# Altium schematic sheet Controller_Sheet.SchDoc
size A4; DocumentNumber: 4; SheetNumber: 4; SheetTotal: 7
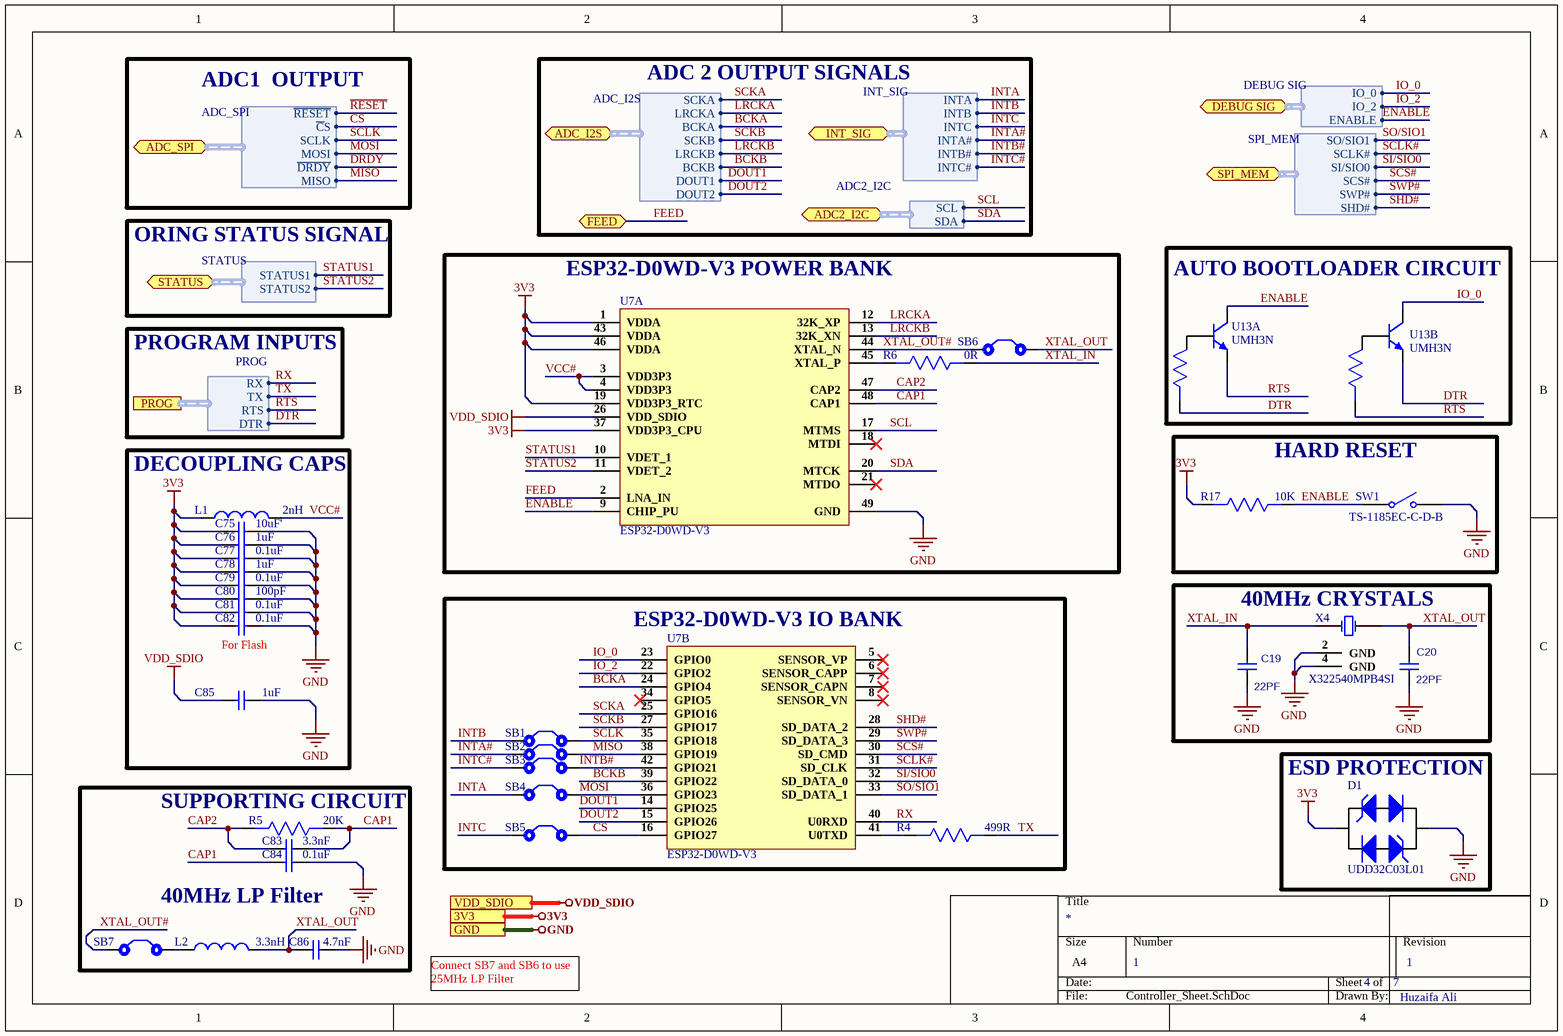
[diagram p0: Controller_Sheet.SchDoc]

## Parts
C19  22PF  [Cap 0402]
C20  22PF  [Cap 0402]
C75  10uF'  [Cap 0603]
C76  1uF  [Cap 0603]
C77  0.1uF  [Cap 0603]
C78  1uF  [Cap 0603]
C79  0.1uF  [Cap 0603]
C80  100pF  [Cap 0603]
C81  0.1uF  [Cap 0603]
C82  0.1uF  [Cap 0603]
C83  3.3nF  [Cap 0402]
C84  0.1uF  [Cap 0603]
C85  1uF  [Cap 0603]
C86  4.7nF  [Cap 0603]
D1  UDD32C03L01  [UDD32C03L01]
L1  2nH  [IND 0603]
L2  3.3nH  [IND 0603]
R4  499R  [Res0603]
R5  20K  [Res0603]
R6  0R  [Res0603]
R17  10K  [Res0603]
SB1  Solder Bridge  [Solder Bridge]  (value not drawn)
SB2  Solder Bridge  [Solder Bridge]  (value not drawn)
SB3  Solder Bridge  [Solder Bridge]  (value not drawn)
SB4  Solder Bridge  [Solder Bridge]  (value not drawn)
SB5  Solder Bridge  [Solder Bridge]  (value not drawn)
SB6  Solder Bridge  [Solder Bridge]  (value not drawn)
SB7  Solder Bridge  [Solder Bridge]  (value not drawn)
SW1  TS-1185EC-C-D-B  [TS-1185EC-C-D-B]
U7  ESP32-D0WD-V3  [ESP32-D0WD-V3]  (parts A,B of 2)
U13  UMH3N  [UMH3N]  (parts A,B of 2)
X4  X322540MPB4SI  [X322540MPB4SI]

## Blocks framed on the sheet
ESP32-D0WD-V3 POWER BANK: R6 SB6 U7
AUTO BOOTLOADER CIRCUIT: U13
DECOUPLING CAPS: C75-C82 C85 L1
HARD RESET: R17 SW1
ESP32-D0WD-V3 IO BANK: R4 SB1-SB5 U7
40MHz CRYSTALS: C19 C20 X4
ESD PROTECTION: D1

## Ports
3V3, ADC2_I2C (bidir, harness ADC2_I2C), ADC_I2S (bidir, harness ADC_I2S), ADC_SPI (bidir, harness ADC_SPI), DEBUG SIG (bidir, harness DEBUG SIG), FEED (bidir), GND, INT_SIG (bidir, harness INT_SIG), PROG (harness PROG), SPI_MEM (bidir, harness SPI_MEM), STATUS (bidir, harness STATUS), VDD_SDIO

## Harnesses
PROG: RX, TX, RTS, DTR
STATUS: STATUS1, STATUS2
ADC_SPI: ~{RESET}, ~{C}S, SCLK, MOSI, ~{DRDY}, MISO
INT_SIG: INTA, INTB, INTC, INTA#, INTB#, INTC#
ADC2_I2C: SCL, SDA
ADC_I2S: SCKA, LRCKA, BCKA, SCKB, LRCKB, BCKB, DOUT1, DOUT2
DEBUG SIG: IO_0, IO_2, ENABLE
SPI_MEM: SO/SIO1, SCLK#, SI/SIO0, SCS#, SWP#, SHD#

## Nets
3V3: C75.1 C76.1 C77.1 C78.1 C79.1 C80.1 C81.1 C82.1 D1.1 L1.1 R17.2 U7.1(VDDA) U7.19(VDD3P3_RTC) U7.37(VDD3P3_CPU) U7.43(VDDA) U7.46(VDDA) ; port 3V3
GND: C19.1 C20.1 C75.2 C76.2 C77.2 C78.2 C79.2 C80.2 C81.2 C82.2 C84.2 C85.2 C86.2 D1.2 SW1.2 U7.49(GND) X4.2(GND) X4.4(GND) ; port GND
VDD_SDIO: C85.1 U7.26(VDD_SDIO) ; port VDD_SDIO
~{C}S: SB5.2 U7.16(GPIO27) ; port ADC_SPI.~{C}S
~{DRDY}: port ADC_SPI.~{DRDY}
~{RESET}: port ADC_SPI.~{RESET}
BCKA: U7.24(GPIO4) ; port ADC_I2S.BCKA
BCKB: U7.39(GPIO22) ; port ADC_I2S.BCKB
CAP1: C83.2 C84.1 R5.1 U7.48(CAP1)
CAP2: C83.1 R5.2 U7.47(CAP2)
DOUT1: U7.14(GPIO25) ; port ADC_I2S.DOUT1
DOUT2: U7.15(GPIO26) ; port ADC_I2S.DOUT2
DTR: U13.2 U13.4(E) ; port PROG.DTR
ENABLE: R17.1 SW1.1 U7.9(CHIP_PU) U13.6(C) ; port DEBUG SIG.ENABLE
FEED: U7.2(LNA_IN) ; port FEED
INTA: SB4.1 ; port INT_SIG.INTA
INTA#: SB2.1 ; port INT_SIG.INTA#
INTB: SB1.1 ; port INT_SIG.INTB
INTB#: SB3.2 U7.42(GPIO21) ; port INT_SIG.INTB#
INTC: SB5.1 ; port INT_SIG.INTC
INTC#: SB3.1 ; port INT_SIG.INTC#
IO_0: U7.23(GPIO0) U13.3(C) ; port DEBUG SIG.IO_0
IO_2: U7.22(GPIO2) ; port DEBUG SIG.IO_2
LRCKA: U7.12(32K_XP) ; port ADC_I2S.LRCKA
LRCKB: U7.13(32K_XN) ; port ADC_I2S.LRCKB
MISO: SB2.2 U7.38(GPIO19) ; port ADC_SPI.MISO
MOSI: SB4.2 U7.36(GPIO23) ; port ADC_SPI.MOSI
RTS: U13.1(E) U13.5 ; port PROG.RTS
RX: U7.40(U0RXD) ; port PROG.RX
SCKA: U7.25(GPIO16) ; port ADC_I2S.SCKA
SCKB: U7.27(GPIO17) ; port ADC_I2S.SCKB
SCL: U7.17(MTMS) ; port ADC2_I2C.SCL
SCLK: SB1.2 U7.35(GPIO18) ; port ADC_SPI.SCLK
SCLK#: U7.31(SD_CLK) ; port SPI_MEM.SCLK#
SCS#: U7.30(SD_CMD) ; port SPI_MEM.SCS#
SDA: U7.20(MTCK) ; port ADC2_I2C.SDA
SHD#: U7.28(SD_DATA_2) ; port SPI_MEM.SHD#
SI/SIO0: U7.32(SD_DATA_0) ; port SPI_MEM.SI/SIO0
SO/SIO1: U7.33(SD_DATA_1) ; port SPI_MEM.SO/SIO1
STATUS1: U7.10(VDET_1) ; port STATUS.STATUS1
STATUS2: U7.11(VDET_2) ; port STATUS.STATUS2
SWP#: U7.29(SD_DATA_3) ; port SPI_MEM.SWP#
TX: R4.1 ; port PROG.TX
VCC#: L1.2 U7.3(VDD3P3) U7.4(VDD3P3)
XTAL_IN: C19.2 R6.1 X4.1(CRYSTAL)
XTAL_OUT: C20.2 C86.1 L2.2 SB6.2 X4.3(CRYSTAL)
XTAL_OUT#: SB6.1 SB7.1 U7.44(XTAL_N)
NetL2_1: L2.1 SB7.2
NetR4_2: R4.2 U7.41(U0TXD)
NetR6_2: R6.2 U7.45(XTAL_P)

Not connected (* = marked no-connect by the designer): U7 5(SENSOR_VP)* 6(SENSOR_CAPP)* 7(SENSOR_CAPN)* 8(SENSOR_VN)* 18(MTDI)* 21(MTDO)* 34(GPIO5)*

## Notes on the sheet
- ADC1  OUTPUT
- ADC 2 OUTPUT SIGNALS
- ORING STATUS SIGNAL
- PROGRAM INPUTS
- (near C82) For Flash
- (near R5) SUPPORTING CIRCUIT
- 40MHz LP Filter
- Connect SB7 and SB6 to use 25MHz LP Filter
- 1
- Huzaifa Ali

## Library data of the parts
C19 C20 = 04025A220FAT2A: CAP CER 22PF 50V C0G/NP0 0402; Manufacturer: Kyocera AVX; Tolerance: 1%; Dielectric: C0G; ComponentLink1URL: http://psearch.murata.com/capacitor/product/GCM219R71C105KA37%23.pdf; ComponentLink1Description: http://psearch.murata.com/capacitor/product/GCM219R71C105KA37%23.pdf; ComponentLink2URL: http://search.murata.co.jp/Ceramy/image/img/A01X/partnumbering_e_02.pdf; ComponentLink2Description: http://search.murata.co.jp/Ceramy/image/img/A01X/partnumbering_e_02.pdf; ComponentLink3URL: http://psearch.en.murata.com/capacitor/product/GCM219R71C105KA37%23.pdf; ComponentLink3Description: http://psearch.en.murata.com/capacitor/product/GCM219R71C105KA37%23.pdf; ComponentLink4URL: http://uk.rs-online.com/webdocs/0ef9/0900766b80ef92d0.pdf; ComponentLink4Description: http://uk.rs-online.com/webdocs/0ef9/0900766b80ef92d0.pdf; ComponentLink5URL: http://www.yageo.com/documents/recent/UPY-GP_NP0_16V-to-50V_16.pdf; ComponentLink5Description: http://www.yageo.com/documents/recent/UPY-GP_NP0_16V-to-50V_16.pdf; ComponentLink6URL: http://www.farnell.com/datasheets/1443161.pdf; ComponentLink6Description: http://www.farnell.com/datasheets/1443161.pdf; ComponentLink7URL: http://www.yageo.com/documents/recent/UPY-GP_NP0_16V-to-50V_8.pdf; ComponentLink7Description: http://www.yageo.com/documents/recent/UPY-GP_NP0_16V-to-50V_8.pdf; ComponentLink8URL: http://www.farnell.com/datasheets/1132289.pdf; ComponentLink8Description: http://www.farnell.com/datasheets/1132289.pdf; ComponentLink9URL: http://www.mouser.com/ds/2/447/Yageo_UPY-GP_NP0_16V-to-50V_9-358835.pdf; ComponentLink9Description: http://www.mouser.com/ds/2/447/Yageo_UPY-GP_NP0_16V-to-50V_9-358835.pdf; ComponentLink10URL: https://www.verical.com/server-webapp/html/getDatasheet?partID=370074; ComponentLink10Description: https://www.verical.com/server-webapp/html/getDatasheet?partID=370074; ComponentLink11URL: http://catalogs.avx.com/SurfaceMount.pdf; ComponentLink11Description: http://catalogs.avx.com/SurfaceMount.pdf; ComponentLink12URL: http://www.avxcorp.com/docs/Catalogs/ccog.pdf; ComponentLink12Description: http://www.avxcorp.com/docs/Catalogs/ccog.pdf; ComponentLink13URL: http://www.mouser.com/ds/2/40/C0GNP0-Dielectric-951274.pdf; ComponentLink13Description: http://www.mouser.com/ds/2/40/C0GNP0-Dielectric-951274.pdf; Supplier 1: Digi-Key; Manufacturer Part Number: 04025A220FAT2A; Stock 1: 100000; Pricing 1: 1=0.67, 10=0.472, 100=0.3105, 500=0.23, 1000=0.1955, 2500=0.184, 5000=0.1725 (USD); Mount: Surface Mount; Case/Package: 0402; Case Code (Metric): 1005; Case Code (Imperial): 0402; Contact Plating: Matte,Tin; Min Operating Temperature: -55°C; Max Operating Temperature: 125°C; Capacitance: 22pF; Packaging: Tape and Reel; Voltage Rating (DC): 50V; Voltage Rating: 50V; Package Quantity: 1; Termination: SMD/SMT; Length: 1mm; Height: 0.56mm; Depth: 0.5mm; Width: 0.02inch; Thickness: 0.022inch; Radiation Hardening: No; REACH SVHC: Unknown; Lead Free: Lead Free; Supplier Part Number 1: 478-5765-1-ND
C75 = CL10A106MA8NRNC: CAP CER 10UF 25V X5R 0603; Manufacturer: Samsung; Tolerance: 20%; Supplier 1: Avnet; Manufacturer Part Number: CL10A106MA8NRNC; RoHS: Yes; Category: Ceramic Capacitors; Pricing 1: 4000=0.03753, 8000=0.03700, 16000=0.03595, 24000=0.03515, 32000=0.03383, 40000=0.03304, 400000=0.03225 (USD); Mount: Surface Mount; Case/Package: 0603; Case Code (Metric): 1608; Case Code (Imperial): 0603; Contact Plating: Tin; Min Operating Temperature: -55°C; Max Operating Temperature: 85°C; Package Quantity: 1; Packaging: Tape and Reel; Capacitance: 10uF; Voltage Rating: 25V; Dielectric: X5R; Termination: Wraparound; Series: CL; Construction: Flat; Length: 0.063inch; Width: 0.031inch; Thickness: 0.035inch; Lead Free: Lead Free; RoHS Compliant: Yes; ComponentLink1URL: https://datasheet.ciiva.com/25766/cl10a106ma8nrnc-25766562.pdf?src-supplier=Digi-Key; ComponentLink1Description: https://datasheet.ciiva.com/25766/cl10a106ma8nrnc-25766562.pdf?src-supplier=Digi-Key; Supplier Part Number 1: CL10A106MA8NRNC
C76 C78 C85 = CC0603KRX5R8BB105: CAP CER 1UF 25V X5R 0603; Manufacturer: Yageo; Tolerance: 10%; Supplier 1: Digi-Key; Manufacturer Part Number: CC0603KRX5R8BB105; RoHS: Yes; Category: Ceramic Capacitors; Stock 1: 919939; Pricing 1: 1=0.12000, 10=0.08400, 50=0.04760, 100=0.03940, 500=0.02764, 1000=0.02288 (USD); Mount: Surface Mount; Case/Package: 0603; Number of Pins: 2; Case Code (Metric): 1608; Case Code (Imperial): 0603; Min Operating Temperature: -55°C; Max Operating Temperature: 85°C; Capacitance: 1uF; Dielectric: X5R; Package Quantity: 1; Voltage Rating: 25V; Packaging: Tape and Reel; Termination: SMD/SMT; Voltage Rating (DC): 25V; Series: CC; Construction: Flat; Length: 1.6mm; Width: 0.031inch; Height: 0.8mm; Thickness: 0.035inch; Depth: 0.8mm; Radiation Hardening: No; REACH SVHC: No SVHC; Lead Free: Lead Free; Halogen Free: Halogen Free; RoHS Compliant: Yes; ComponentLink1URL: https://datasheet.ciiva.com/176/mlccorderingcode-176785.pdf?src-supplier=Digi-Key; ComponentLink1Description: https://datasheet.ciiva.com/176/mlccorderingcode-176785.pdf?src-supplier=Digi-Key; ComponentLink2URL: https://datasheet.ciiva.com/176/mlccorderingcode-176786.pdf?src-supplier=Digi-Key; ComponentLink2Description: https://datasheet.ciiva.com/176/mlccorderingcode-176786.pdf?src-supplier=Digi-Key; ComponentLink3URL: https://datasheet.ciiva.com/176/mlccorderingcode-176787.pdf?src-supplier=Digi-Key; ComponentLink3Description: https://datasheet.ciiva.com/176/mlccorderingcode-176787.pdf?src-supplier=Digi-Key; ComponentLink4URL: https://datasheet.ciiva.com/17436/upy-gphc-x5r-4v-to-50v-12-17436952.pdf?src-supplier=Avnet+Europe; ComponentLink4Description: https://datasheet.ciiva.com/17436/upy-gphc-x5r-4v-to-50v-12-17436952.pdf?src-supplier=Avnet+Europe; ComponentLink5URL: https://datasheet.ciiva.com/7978/1525783-7978171.pdf?src-supplier=Element14; ComponentLink5Description: https://datasheet.ciiva.com/7978/1525783-7978171.pdf?src-supplier=Element14; ComponentLink6URL: https://datasheet.ciiva.com/11586/upy-gphc-x5r-4v-to-50v-12-11586318.pdf?src-supplier=Avnet; ComponentLink6Description: https://datasheet.ciiva.com/11586/upy-gphc-x5r-4v-to-50v-12-11586318.pdf?src-supplier=Avnet; Supplier Part Number 1: 311-1445-1-ND
C77 C79 C81 C82 C84 = CC0603KRX7R0BB104: CAP CER 0.1UF 100V X7R 0603; Manufacturer: Yageo; Capacitance: 100nF; Tolerance: 10%; Supplier 1: Digi-Key; Manufacturer Part Number: CC0603KRX7R0BB104; RoHS: Yes; Category: Ceramic Capacitors; Stock 1: 60476; Pricing 1: 1=0.19000, 10=0.13500, 50=0.07680, 100=0.06370, 500=0.04466, 1000=0.03696 (USD); Mount: Surface Mount; Case/Package: 0603; Case Code (Metric): 1608; Case Code (Imperial): 0603; Weight: 7.1E-05oz; Min Operating Temperature: -55°C; Max Operating Temperature: 125°C; Package Quantity: 4000; Voltage Rating: 100V; Packaging: Tape and Reel; Dielectric: X7R; Termination: SMD/SMT; Resistor Type: Ceramic; Voltage Rating (DC): 100V; Series: CC; Length: 0.063inch; Width: 0.031inch; Thickness: 0.035inch; Depth: 0.8mm; Lead Free: Lead Free; RoHS Compliant: Yes; ComponentLink1URL: https://datasheet.ciiva.com/6277/mlccorderingcode-6277030.pdf?src-supplier=Digi-Key; ComponentLink1Description: https://datasheet.ciiva.com/6277/mlccorderingcode-6277030.pdf?src-supplier=Digi-Key; ComponentLink2URL: https://datasheet.ciiva.com/6277/mlccorderingcode-6277081.pdf?src-supplier=Digi-Key; ComponentLink2Description: https://datasheet.ciiva.com/6277/mlccorderingcode-6277081.pdf?src-supplier=Digi-Key; ComponentLink3URL: https://datasheet.ciiva.com/6277/mlccorderingcode-6277082.pdf?src-supplier=Digi-Key; ComponentLink3Description: https://datasheet.ciiva.com/6277/mlccorderingcode-6277082.pdf?src-supplier=Digi-Key; Supplier Part Number 1: 311-1523-1-ND
C80 = CC0603KRX7R8BB101: CAP CER 100PF 25V X7R 0603; Manufacturer: Yageo; Tolerance: 10%; Supplier 1: Avnet; Manufacturer Part Number: CC0603KRX7R8BB101; RoHS: Yes; Category: Ceramic Capacitors; Stock 1: 12000; Pricing 1: 4000=0.00493, 8000=0.00479, 16000=0.00466, 24000=0.00452, 32000=0.00439 (USD); Mount: Surface Mount; Case/Package: 0603; Case Code (Imperial): 0603; Case Code (Metric): 1608; Weight: 7.1E-05oz; Min Operating Temperature: -55°C; Max Operating Temperature: 125°C; Packaging: Tape and Reel; Capacitance: 100pF; Voltage Rating (DC): 25V; Dielectric: X7R; Voltage Rating: 25V; Termination: SMD/SMT; Resistor Type: Ceramic; Series: CC; Length: 0.063inch; Width: 0.031inch; Thickness: 0.035inch; Depth: 0.8mm; Lead Free: Lead Free; Halogen Free: Halogen Free; RoHS Compliant: Yes; ComponentLink1URL: https://datasheet.ciiva.com/13265/upy-gphc-x7r-6-3v-to-50v-8-12304-13265007.pdf?src-supplier=Mouser; ComponentLink1Description: https://datasheet.ciiva.com/13265/upy-gphc-x7r-6-3v-to-50v-8-12304-13265007.pdf?src-supplier=Mouser; Supplier Part Number 1: CC0603KRX7R8BB101
C83 = CGA2B2X7R1H332M050BA: CAP CER 3300PF 50V X7R 0402; Manufacturer: TDK; Tolerance: 20%; Supplier 1: Digi-Key; Manufacturer Part Number: CGA2B2X7R1H332M050BA; RoHS: Yes; Category: Ceramic Capacitors; Stock 1: 30365; Pricing 1: 1=0.10000, 10=0.05400, 50=0.02960, 100=0.02430, 500=0.01732, 1000=0.01361, 2500=0.01238, 5000=0.01138 (USD); Mount: Surface Mount; Case/Package: 0402; Case Code (Metric): 1005; Case Code (Imperial): 0402; Min Operating Temperature: -55°C; Max Operating Temperature: 125°C; Package Quantity: 10000; Packaging: Tape and Reel; Capacitance: 3.3nF; Voltage Rating: 50V; Series: CGA; Length: 0.039inch; Width: 0.02inch; Thickness: 0.022inch; Ratings: AEC-Q200; RoHS Compliant: Yes; ComponentLink1URL: https://product.tdk.com/info/en/documents/chara_sheet/CGA2B2X7R1H332M050BA.pdf?src-supplier=Digi-Key; ComponentLink1Description: https://product.tdk.com/info/en/documents/chara_sheet/CGA2B2X7R1H332M050BA.pdf?src-supplier=Digi-Key; ComponentLink2URL: https://product.tdk.com/info/en/catalog/datasheets/mlcc_automotive_general_en.pdf?src-supplier=Digi-Key; ComponentLink2Description: https://product.tdk.com/info/en/catalog/datasheets/mlcc_automotive_general_en.pdf?src-supplier=Digi-Key; ComponentLink3URL: http://product.tdk.com/en/catalog/datasheets/mlcc_automotive_general_en.pdf?src-supplier=Avnet; ComponentLink3Description: http://product.tdk.com/en/catalog/datasheets/mlcc_automotive_general_en.pdf?src-supplier=Avnet; Supplier Part Number 1: 445-12276-1-ND
C86 = CC0603KRX7R8BB472: CAP SMD 4700pF ±10% 25V X7R 0603; Manufacturer: Yageo; Supplier 1: Mouser; Manufacturer Part Number: CC0603KRX7R8BB472; RoHS: Yes; Category: Ceramic Capacitors; Stock 1: 6256; Pricing 1: 1=0.10000, 10=0.02900, 50=0.02900, 100=0.02400, 500=0.01700, 1000=0.01400, 2000=0.01300, 4000=0.01000, 8000=0.00900, 10000=0.00900 (USD); Mount: Surface Mount; Case/Package: 0603; Case Code (Imperial): 0603; Case Code (Metric): 1608; Weight: 7.1E-05oz; Min Operating Temperature: -55°C; Max Operating Temperature: 125°C; Packaging: Tape and Reel; Capacitance: 4.7nF; Tolerance: 10%; Voltage Rating (DC): 25V; Voltage Rating: 25V; Dielectric: X7R; Termination: SMD/SMT; Resistor Type: Ceramic; Series: CC; Length: 1.6mm; Width: 0.031inch; Thickness: 0.035inch; Depth: 0.8mm; Radiation Hardening: No; Lead Free: Lead Free; Halogen Free: Halogen Free; RoHS Compliant: Yes; ComponentLink1URL: https://datasheet.ciiva.com/26862/getdatasheetpartid-650523-26862841.pdf?src-supplier=Verical; ComponentLink1Description: https://datasheet.ciiva.com/26862/getdatasheetpartid-650523-26862841.pdf?src-supplier=Verical; ComponentLink2URL: https://datasheet.ciiva.com/13208/upy-gphc-x7r-6-3v-to-50v-8-12304-13208589.pdf?src-supplier=Mouser; ComponentLink2Description: https://datasheet.ciiva.com/13208/upy-gphc-x7r-6-3v-to-50v-8-12304-13208589.pdf?src-supplier=Mouser; Supplier Part Number 1: 603-CC603KRX7R8BB472
D1 = UDD32C03L01: 15V 19A 3.3V 4V Bidirectional SOD-323 ESD Protection Devices ROHS; Manufacturer: Brightking; Manufacturer Part No: UDD32C03L01; Package: SOD-323; ComponentLink1Description: LCSC; ComponentLink1URL: https://lcsc.com/product-detail/span-style-background-color-ff0-ESD-span-Protection-Devices_Brightking-Elec-TAIWAN-UDD32C03L01_C78439.html
L1 = SDCL1608C2N0STDF: 2nH ±0.3nH 0603 Inductors; Manufacturer: Sunlord; Rated Current: 300mA; Inductance: 2nH; Package Case: 0603
L2 = LQG18HN3N3S00D: FIXED IND 3.3NH 1A 120 MOHM SMD; Manufacturer: Murata; Core Material: Air; Max DC Current: 500mA; DC Resistance (DCR): 150mR; Q Factor: 12; Self Resonant Frequency: 6GHz; Shielding: Unshielded; Test Frequency: 100MHz; Supplier 1: RSComponents; Manufacturer Part Number: LQG18HN3N3S00D; RoHS: Yes; Category: Fixed Inductors; Stock 1: 1; Pricing 1: 10=0.18800, 500=0.08200, 1000=0.07100, 2000=0.05900, 5000=0.05600 (USD); Mount: Surface Mount; Case/Package: 0603; Case Code (Metric): 1608; Case Code (Imperial): 0603; Min Operating Temperature: -55°C; Max Operating Temperature: 85°C; Inductance: 3.3nH; Packaging: Tape and Reel; Package Quantity: 4000; Current Rating: 500mA; Termination: SMD/SMT; DC Current: 500mA; Series: LQG18H; Rated Current-Max: 500mA; Length: 1.6mm; Width: 0.8mm; Height: 0.8mm; Height - Seated (Max): 0.037inch; Depth: 0.95mm; Radiation Hardening: No; REACH SVHC: No SVHC; Military Standard: Not; Lead Free: Lead Free; RoHS Compliant: Yes; ComponentLink1URL: https://datasheet.ciiva.com/11801/0900766b80f1087c-11801482.pdf?src-supplier=RSComponents; ComponentLink1Description: https://datasheet.ciiva.com/11801/0900766b80f1087c-11801482.pdf?src-supplier=RSComponents; ComponentLink2URL: https://datasheet.ciiva.com/8510/l0075s0083lqg18h-8510694.pdf?src-supplier=Avnet; ComponentLink2Description: https://datasheet.ciiva.com/8510/l0075s0083lqg18h-8510694.pdf?src-supplier=Avnet; ComponentLink3URL: https://datasheet.ciiva.com/8002/5102-8002599.pdf?src-supplier=Element14; ComponentLink3Description: https://datasheet.ciiva.com/8002/5102-8002599.pdf?src-supplier=Element14; ComponentLink4URL: https://datasheet.ciiva.com/6690/l0075s0083lqg18h-6690799.pdf?src-supplier=Digi-Key; ComponentLink4Description: https://datasheet.ciiva.com/6690/l0075s0083lqg18h-6690799.pdf?src-supplier=Digi-Key; ComponentLink5URL: https://datasheet.ciiva.com/4978/o05e-4978491.pdf?src-supplier=Mouser; ComponentLink5Description: https://datasheet.ciiva.com/4978/o05e-4978491.pdf?src-supplier=Mouser; ComponentLink6URL: https://datasheet.ciiva.com/18089/getdatasheetpartid-180322-18089964.pdf?src-supplier=Verical; ComponentLink6Description: https://datasheet.ciiva.com/18089/getdatasheetpartid-180322-18089964.pdf?src-supplier=Verical; ComponentLink7URL: https://datasheet.ciiva.com/6690/l0075s0083lqg18h-6690797.pdf?src-supplier=Digi-Key; ComponentLink7Description: https://datasheet.ciiva.com/6690/l0075s0083lqg18h-6690797.pdf?src-supplier=Digi-Key; ComponentLink8URL: https://datasheet.ciiva.com/6690/l0075s0083lqg18h-6690798.pdf?src-supplier=Digi-Key; ComponentLink8Description: https://datasheet.ciiva.com/6690/l0075s0083lqg18h-6690798.pdf?src-supplier=Digi-Key; Supplier Part Number 1: 7254954
R4 = RC0603FR-07499RL: RES SMD 499Ω ± 1.00% 0.1W ± 100ppm/℃ 0603; Manufacturer: Yageo; Tolerance: 1%; Temperature Coefficient: 100ppm/°C; Power Rating: 100mW; Voltage Rating: 50V; Supplier 1: RSComponents; Manufacturer Part Number: RC0603FR-07499RL; RoHS: Yes; Category: Chip SMD Resistors; Stock 1: 900; Pricing 1: 5000=0.00300, 10000=0.00300, 15000=0.00300, 20000=0.00200 (GBP); Mount: Surface Mount; Case/Package: 0603; Contact Plating: Tin,Matte; Case Code (Metric): 1608; Case Code (Imperial): 0603; Size Code: 0603; Min Operating Temperature: -55°C; Max Operating Temperature: 155°C; Resistance: 499R; Resistor Type: Thick Film; Package Quantity: 1; Packaging: Tape and Reel; Number of Terminations: 2; Termination: SMD/SMT; Max Power Dissipation: 100mW; Voltage Rating (DC): 50V; Features: Moisture Resistant; Series: RC; Construction: Rectangular; Technology: THICK FILM; Length: 1.6mm; Width: 0.031inch; Height: 0.45mm; Depth: 0.8mm; Radiation Hardening: No; Military Standard: Not; Lead Free: Lead Free; RoHS Compliant: Yes; ComponentLink1URL: https://datasheet.ciiva.com/11808/0900766b80f96399-11808558.pdf?src-supplier=RSComponents; ComponentLink1Description: https://datasheet.ciiva.com/11808/0900766b80f96399-11808558.pdf?src-supplier=RSComponents; ComponentLink2URL: https://datasheet.ciiva.com/2453/pyu-r-int-thick-7-2453956.pdf?src-supplier=Digi-Key; ComponentLink2Description: https://datasheet.ciiva.com/2453/pyu-r-int-thick-7-2453956.pdf?src-supplier=Digi-Key; ComponentLink3URL: https://datasheet.ciiva.com/2453/pyu-r-int-thick-7-2453957.pdf?src-supplier=Digi-Key; ComponentLink3Description: https://datasheet.ciiva.com/2453/pyu-r-int-thick-7-2453957.pdf?src-supplier=Digi-Key; ComponentLink4URL: https://datasheet.ciiva.com/2453/pyu-r-int-thick-7-2453955.pdf?src-supplier=Digi-Key; ComponentLink4Description: https://datasheet.ciiva.com/2453/pyu-r-int-thick-7-2453955.pdf?src-supplier=Digi-Key; ComponentLink5URL: https://datasheet.ciiva.com/12558/rc0603-272842-12558391.pdf?src-supplier=Mouser; ComponentLink5Description: https://datasheet.ciiva.com/12558/rc0603-272842-12558391.pdf?src-supplier=Mouser; ComponentLink6URL: https://datasheet.ciiva.com/8885/pyu-rc0603-51-rohs-l-4-8885483.pdf?src-supplier=Avnet; ComponentLink6Description: https://datasheet.ciiva.com/8885/pyu-rc0603-51-rohs-l-4-8885483.pdf?src-supplier=Avnet; Supplier Part Number 1: 1995585
R5 = RC0603FR-0720KL: RES SMD 20K OHM 1% 1/10W 0603
R6 = RC0603FR-070RL: RES SMD 0R, 1%, 0.1W, 0603; Manufacturer: Yageo; Resistance: 0mR; Power Rating: 100mW; Voltage Rating (DC): 50V; Temperature Coefficient: 200ppm/°C; Current Rating: 1A; Working Voltage: 75V; Supplier 1: Arrow Electronics; Manufacturer Part Number: RC0603FR-070RL; RoHS: Yes; Category: Chip SMD Resistors; Stock 1: 1270000; Pricing 1: 5000=0.00320, 5000=0.00490, 50000=0.00450, 500000=0.00250, 2500000=0.00150 (USD); Case/Package: 0603; Number of Pins: 2; Contact Plating: Tin,Matte; Case Code (Metric): 1608; Case Code (Imperial): 0603; Min Operating Temperature: -55°C; Max Operating Temperature: 155°C; Resistor Type: Thick Film; Packaging: Tape and Reel; Tolerance: 1%; Package Quantity: 5000; Voltage Rating: 50V; Number of Terminations: 2; Termination: SMD/SMT; Max Power Dissipation: 100mW; Features: Moisture Resistant; Length: 1.6mm; Width: 0.031inch; Height: 0.45mm; Depth: 0.8mm; Radiation Hardening: No; REACH SVHC: No SVHC; Lead Free: Lead Free; Military Standard: Not; ComponentLink1URL: https://datasheet.ciiva.com/11808/0900766b80f96399-11808172.pdf?src-supplier=RSComponents; ComponentLink1Description: https://datasheet.ciiva.com/11808/0900766b80f96399-11808172.pdf?src-supplier=RSComponents; ComponentLink2URL: https://datasheet.ciiva.com/5558/rc0603-272842-5558341.pdf?src-supplier=Mouser; ComponentLink2Description: https://datasheet.ciiva.com/5558/rc0603-272842-5558341.pdf?src-supplier=Mouser; ComponentLink3URL: https://datasheet.ciiva.com/46382/443971-46382072.pdf?src-supplier=Element14; ComponentLink3Description: https://datasheet.ciiva.com/46382/443971-46382072.pdf?src-supplier=Element14; ComponentLink4URL: https://datasheet.ciiva.com/29721/pyu-r-int-thick-7-29721178.pdf?src-supplier=Digi-Key; ComponentLink4Description: https://datasheet.ciiva.com/29721/pyu-r-int-thick-7-29721178.pdf?src-supplier=Digi-Key; ComponentLink5URL: https://datasheet.ciiva.com/5684/443971-5684699.pdf?src-supplier=Farnell; ComponentLink5Description: https://datasheet.ciiva.com/5684/443971-5684699.pdf?src-supplier=Farnell; ComponentLink6URL: https://datasheet.ciiva.com/7983/443971-7983627.pdf?src-supplier=Element14; ComponentLink6Description: https://datasheet.ciiva.com/7983/443971-7983627.pdf?src-supplier=Element14; ComponentLink7URL: https://datasheet.ciiva.com/29721/pyu-rc0603-51-rohs-l-4-29721179.pdf?src-supplier=Digi-Key; ComponentLink7Description: https://datasheet.ciiva.com/29721/pyu-rc0603-51-rohs-l-4-29721179.pdf?src-supplier=Digi-Key; ComponentLink8URL: https://datasheet.ciiva.com/22643/1868787-22643388.pdf?src-supplier=Element14; ComponentLink8Description: https://datasheet.ciiva.com/22643/1868787-22643388.pdf?src-supplier=Element14; Supplier Part Number 1: RC0603FR-070RL
R17 = RC0603FR-0710KL: RES SMD 10K OHM 1% 1/10W 0603; Manufacturer: Yageo; Resistance: 10kR; Temperature Coefficient: 100ppm/°C; Voltage Rating (DC): 50V; Power Rating: 100mW; Voltage Rating: 75V; Supplier 1: Digi-Key; Manufacturer Part Number: RC0603FR-0710KL; Stock 1: 144725424; Pricing 1: 1=0.1, 10=0.024, 100=0.0097, 1000=0.00437, 2500=0.00379 (USD); Case/Package: 0603; Number of Pins: 2; Weight: 7.1E-05oz; Case Code (Imperial): 0603; Case Code (Metric): 1608; Min Operating Temperature: -55°C; Max Operating Temperature: 155°C; Tolerance: 1%; Composition: Thick Film; Packaging: Tape and Reel; Military Standard: Not; Termination: SMD/SMT; Length: 1.6mm; Height: 0.45mm; Width: 0.8mm; Depth: 0.8mm; Lead Pitch: 0.3mm; REACH SVHC: No SVHC; Lead Free: Lead Free; ComponentLink1URL: http://www.farnell.com/datasheets/38590.pdf?src-supplier=Element14; ComponentLink1Description: http://www.farnell.com/datasheets/38590.pdf?src-supplier=Element14; ComponentLink2URL: https://www.verical.com/server-webapp/html/getDatasheet?partID=409289&src-supplier=Verical; ComponentLink2Description: https://www.verical.com/server-webapp/html/getDatasheet?partID=409289&src-supplier=Verical; ComponentLink3URL: http://www.farnell.com/datasheets/1868787.pdf?src-supplier=Element14; ComponentLink3Description: http://www.farnell.com/datasheets/1868787.pdf?src-supplier=Element14; ComponentLink4URL: http://www.farnell.com/datasheets/2167052.pdf?src-supplier=Element14; ComponentLink4Description: http://www.farnell.com/datasheets/2167052.pdf?src-supplier=Element14; ComponentLink5URL: http://www.farnell.com/datasheets/443971.pdf?src-supplier=Element14; ComponentLink5Description: http://www.farnell.com/datasheets/443971.pdf?src-supplier=Element14; Supplier Part Number 1: 311-10.0KHRDKR-ND
SB1-SB7 = Solder Bridge: Solder Bridge ON
SW1 = TS-1185EC-C-D-B: 3mm 2mm Round Button 50mA Top3.65mm SPST 12V SMD Tactile Switches; Manufacturer: XKB; Manufacturer Part No: TS-1185EC-C-D-B; Package: Custom; ComponentLink1Description: LCSC; ComponentLink1URL: https://lcsc.com/product-detail/Tactile-Switches_XKB-Connectivity-TS-1185EC-C-D-B_C318893.html
U7 = ESP32-D0WD-V3: IC RF TXRX+MCU BLUETOOTH WIFI; Manufacturer: Espressif Systems; Supplier 1: Digi-Key; Manufacturer Part Number: ESP32-D0WD-V3; RoHS: No; Category: RF Receivers, Transceivers; Stock 1: 29666; Pricing 1: 1=1.80000 (USD); Supplier Part Number 1: 1904-ESP32-D0WD-V3CT-ND
U13 = UMH3N: 2 NPN pre-biased (Dual) 150mW 100mA 50V SC-70-6(SOT-363) Digital Transistors ROHS; Manufacturer: Changjiang; Manufacturer Part No: UMH3N; Package: SC-70-6(SOT-363); ComponentLink1Description: LCSC; ComponentLink1URL: https://www.lcsc.com/product-detail/Digital-Transistors_Changjiang-Electronics-Tech-CJ-UMH3N_C62892.html
X4 = X322540MPB4SI: 40MHz SMD Crystal Resonator 15pF ±10ppm ±30ppm -40℃~+85℃ SMD3225-4P Crystals ROHS; Manufacturer: Yangxing Tech; Manufacturer Part No: X322540MPB4SI; Value: 40MHZ